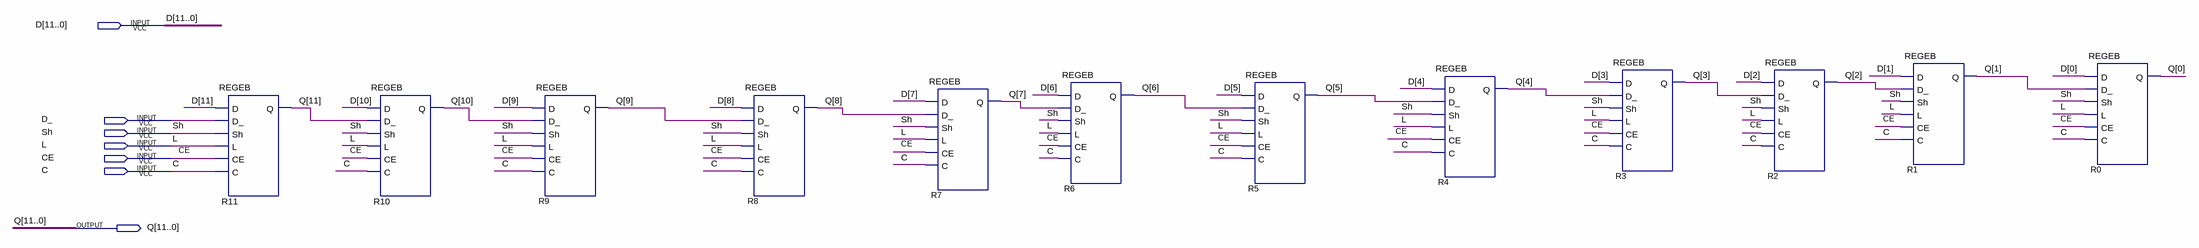
[diagram p0: schematic sheet]
// Quartus schematic REG.bdf as structural Verilog: 12 symbols, 7 pins
module REG (
  input  [11:0] D,
  input  D_,
  input  Sh,
  input  L,
  input  CE,
  input  C,
  output [11:0] Q
);

  REGEB R11 (.D(D[11]), .D_(D_), .Sh(Sh), .L(L), .CE(CE), .C(C), .Q(Q[11]));
  REGEB R10 (.D(D[10]), .D_(Q[11]), .Sh(Sh), .L(L), .CE(CE), .C(C), .Q(Q[10]));
  REGEB R9 (.D(D[9]), .D_(Q[10]), .Sh(Sh), .L(L), .CE(CE), .C(C), .Q(Q[9]));
  REGEB R8 (.D(D[8]), .D_(Q[9]), .Sh(Sh), .L(L), .CE(CE), .C(C), .Q(Q[8]));
  REGEB R7 (.D(D[7]), .D_(Q[8]), .Sh(Sh), .L(L), .CE(CE), .C(C), .Q(Q[7]));
  REGEB R6 (.D(D[6]), .D_(Q[7]), .Sh(Sh), .L(L), .CE(CE), .C(C), .Q(Q[6]));
  REGEB R5 (.D(D[5]), .D_(Q[6]), .Sh(Sh), .L(L), .CE(CE), .C(C), .Q(Q[5]));
  REGEB R4 (.D(D[4]), .D_(Q[5]), .Sh(Sh), .L(L), .CE(CE), .C(C), .Q(Q[4]));
  REGEB R3 (.D(D[3]), .D_(Q[4]), .Sh(Sh), .L(L), .CE(CE), .C(C), .Q(Q[3]));
  REGEB R2 (.D(D[2]), .D_(Q[3]), .Sh(Sh), .L(L), .CE(CE), .C(C), .Q(Q[2]));
  REGEB R1 (.D(D[1]), .D_(Q[2]), .Sh(Sh), .L(L), .CE(CE), .C(C), .Q(Q[1]));
  REGEB R0 (.D(D[0]), .D_(Q[1]), .Sh(Sh), .L(L), .CE(CE), .C(C), .Q(Q[0]));
endmodule
